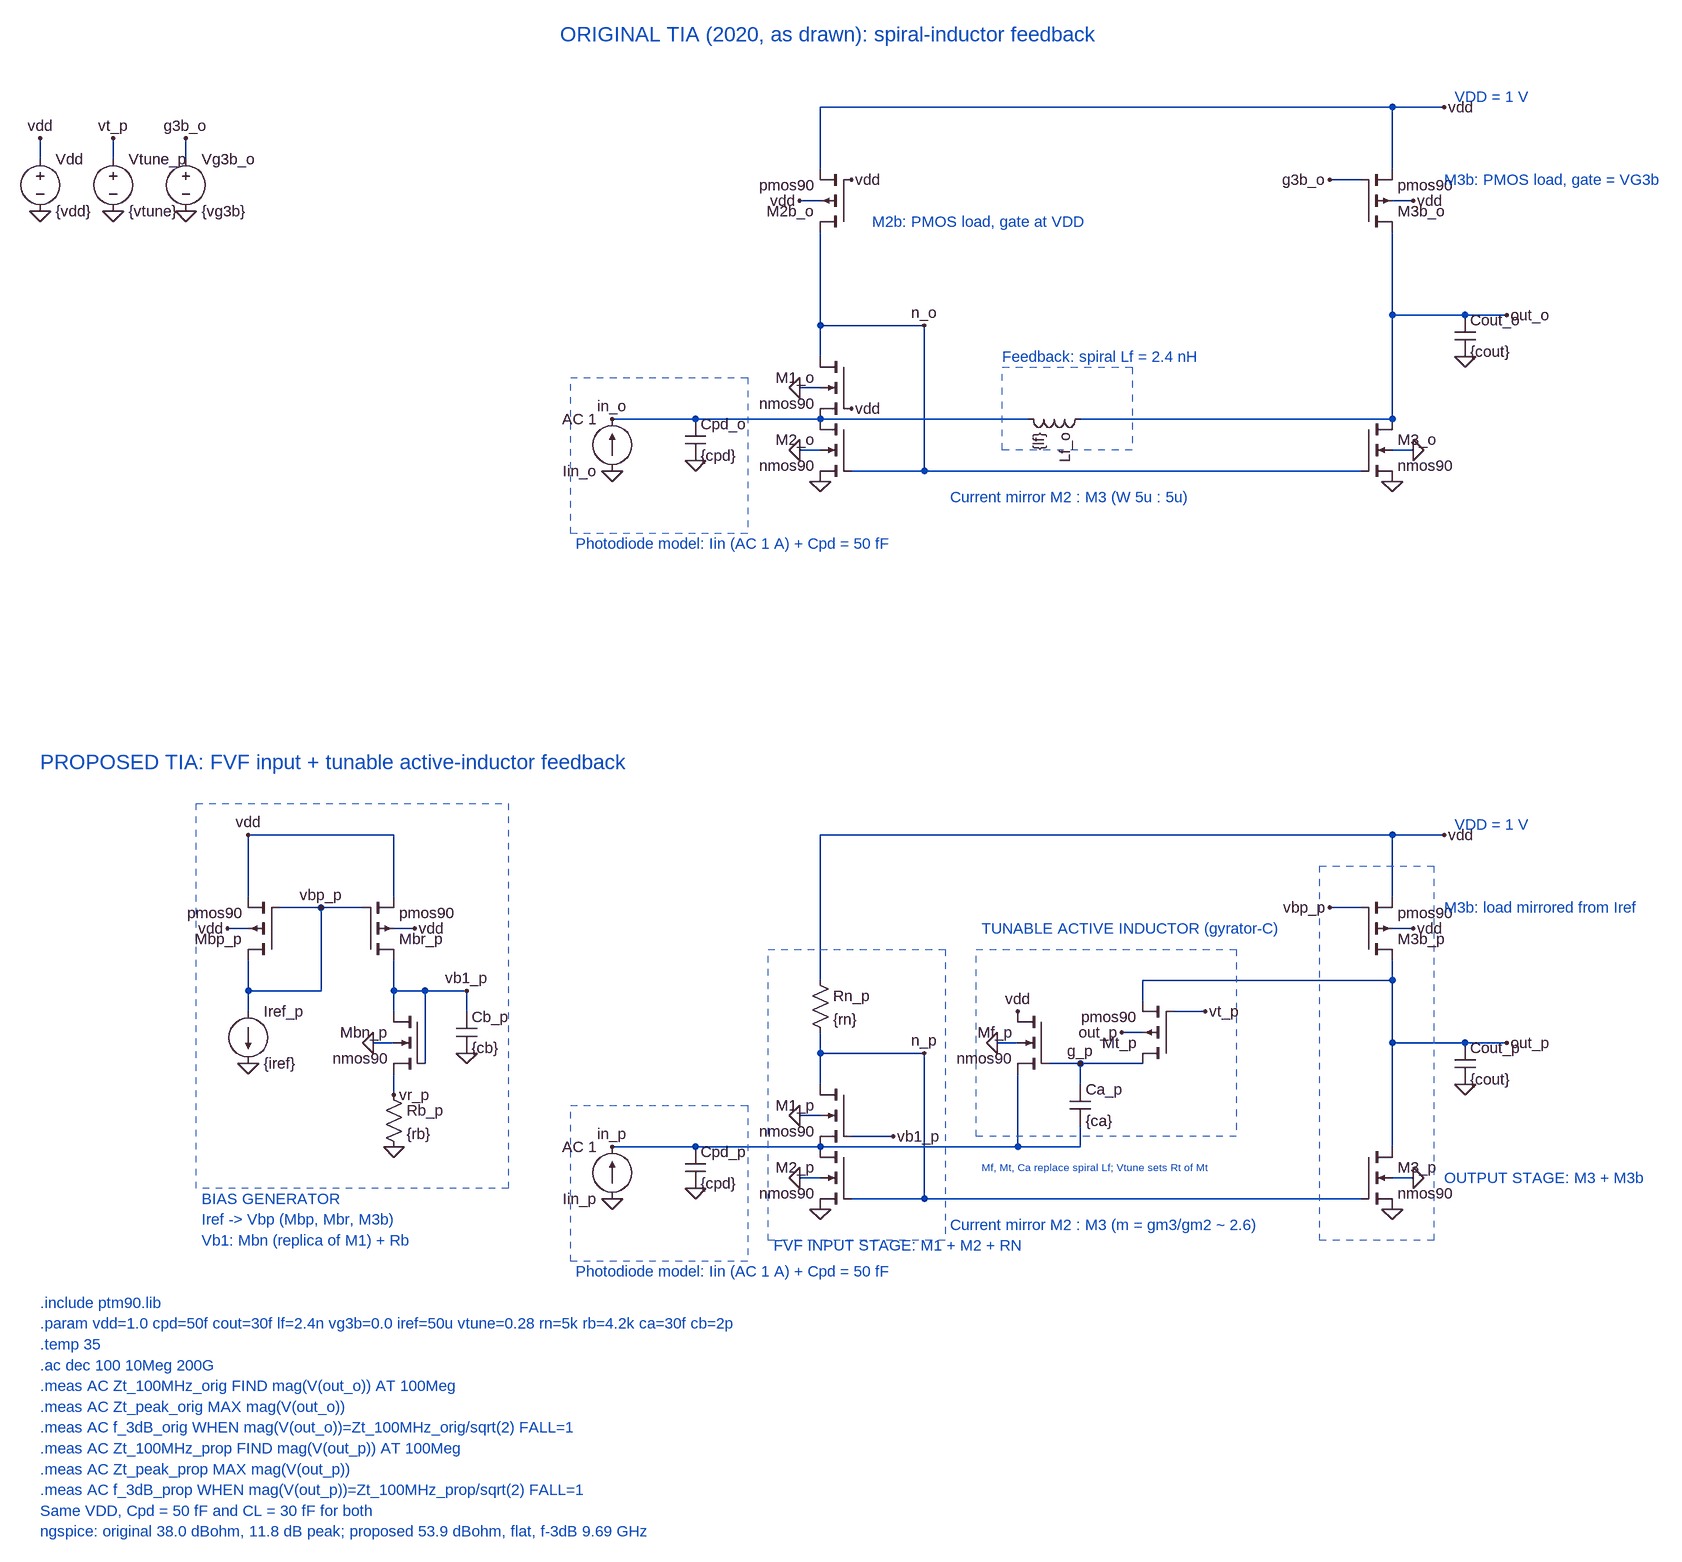
[diagram p0: schematic 5_original_vs_proposed.asc]
5_original_vs_proposed.asc, the LTspice schematic file:
Version 4
SHEET 1 3200 2800
WIRE 320 528 288 528
WIRE 1200 528 1232 528
WIRE 0 480 128 480
WIRE 128 480 320 480
WIRE 320 336 320 384
WIRE 320 336 480 336
WIRE 480 336 480 560
WIRE 368 560 480 560
WIRE 480 560 1152 560
WIRE 1200 192 1200 224
WIRE 1200 224 1200 320
WIRE 1200 320 1200 480
WIRE 1200 320 1312 320
WIRE 1312 320 1376 320
WIRE 320 0 1200 0
WIRE 1200 0 1280 0
WIRE 320 144 288 144
WIRE 320 96 320 0
WIRE 320 192 320 336
WIRE 320 432 288 432
WIRE 1200 144 1232 144
WIRE 1200 96 1200 0
WIRE 1152 112 1104 112
WIRE 320 480 640 480
WIRE 720 480 1200 480
WIRE 320 1648 288 1648
WIRE 1200 1648 1232 1648
WIRE 0 1600 128 1600
WIRE 128 1600 320 1600
WIRE 320 1456 320 1504
WIRE 320 1456 480 1456
WIRE 480 1456 480 1680
WIRE 368 1680 480 1680
WIRE 480 1680 1152 1680
WIRE 1200 1312 1200 1344
WIRE 1200 1344 1200 1440
WIRE 1200 1440 1200 1600
WIRE 1200 1440 1312 1440
WIRE 1312 1440 1376 1440
WIRE 320 1120 1200 1120
WIRE 1200 1120 1280 1120
WIRE 320 1344 320 1120
WIRE 320 1424 320 1456
WIRE 368 1584 432 1584
WIRE 320 1552 288 1552
WIRE 1200 1264 1232 1264
WIRE 1200 1216 1200 1120
WIRE 1152 1232 1104 1232
WIRE 624 1488 624 1600
WIRE 320 1600 624 1600
WIRE 624 1600 720 1600
WIRE 624 1440 592 1440
WIRE 720 1568 720 1600
WIRE 672 1472 720 1472
WIRE 720 1472 816 1472
WIRE 720 1472 720 1504
WIRE 816 1424 784 1424
WIRE 816 1376 816 1344
WIRE 816 1344 1200 1344
WIRE 864 1392 912 1392
WIRE -560 1264 -592 1264
WIRE -336 1264 -304 1264
WIRE -560 1216 -560 1120
WIRE -560 1120 -336 1120
WIRE -336 1120 -336 1216
WIRE -512 1232 -448 1232
WIRE -448 1232 -384 1232
WIRE -448 1232 -448 1360
WIRE -560 1312 -560 1360
WIRE -560 1360 -448 1360
WIRE -560 1360 -560 1392
WIRE -336 1312 -336 1360
WIRE -336 1360 -336 1392
WIRE -336 1360 -288 1360
WIRE -288 1360 -224 1360
WIRE -288 1360 -288 1472
WIRE -336 1440 -368 1440
WIRE -224 1360 -224 1392
WIRE -336 1488 -336 1520
WIRE -880 80 -880 48
WIRE -768 80 -768 48
WIRE -656 80 -656 48
FLAG 0 560 0
FLAG 0 480 in_o
FLAG 128 544 0
FLAG 288 528 0
FLAG 320 576 0
FLAG 1232 528 0
FLAG 1200 576 0
FLAG 480 336 n_o
FLAG 1312 384 0
FLAG 1376 320 out_o
FLAG 1280 0 vdd
FLAG 288 144 vdd
FLAG 368 112 vdd
FLAG 368 464 vdd
FLAG 288 432 0
FLAG 1232 144 vdd
FLAG 1104 112 g3b_o
FLAG 0 1680 0
FLAG 0 1600 in_p
FLAG 128 1664 0
FLAG 288 1648 0
FLAG 320 1696 0
FLAG 1232 1648 0
FLAG 1200 1696 0
FLAG 480 1456 n_p
FLAG 1312 1504 0
FLAG 1376 1440 out_p
FLAG 1280 1120 vdd
FLAG 432 1584 vb1_p
FLAG 288 1552 0
FLAG 1232 1264 vdd
FLAG 1104 1232 vbp_p
FLAG 624 1392 vdd
FLAG 592 1440 0
FLAG 720 1472 g_p
FLAG 784 1424 out_p
FLAG 912 1392 vt_p
FLAG -592 1264 vdd
FLAG -304 1264 vdd
FLAG -560 1120 vdd
FLAG -448 1232 vbp_p
FLAG -560 1472 0
FLAG -368 1440 0
FLAG -224 1456 0
FLAG -224 1360 vb1_p
FLAG -336 1520 vr_p
FLAG -336 1600 0
FLAG -880 48 vdd
FLAG -880 160 0
FLAG -768 48 vt_p
FLAG -768 160 0
FLAG -656 48 g3b_o
FLAG -656 160 0
SYMBOL current 0 560 R180
SYMATTR InstName Iin_o
SYMATTR Value AC 1
SYMBOL cap 112 480 R0
SYMATTR InstName Cpd_o
SYMATTR Value {cpd}
SYMBOL nmos4 368 480 M0
SYMATTR InstName M2_o
SYMATTR Value nmos90
SYMATTR Value2 l=90n w=5u ad=1p as=1p pd=10.4u ps=10.4u
SYMBOL nmos4 368 384 M0
SYMATTR InstName M1_o
SYMATTR Value nmos90
SYMATTR Value2 l=90n w=5u ad=1p as=1p pd=10.4u ps=10.4u
SYMBOL nmos4 1152 480 R0
SYMATTR InstName M3_o
SYMATTR Value nmos90
SYMATTR Value2 l=90n w=5u ad=1p as=1p pd=10.4u ps=10.4u
SYMBOL cap 1296 320 R0
SYMATTR InstName Cout_o
SYMATTR Value {cout}
SYMBOL pmos4 368 192 R180
SYMATTR InstName M2b_o
SYMATTR Value pmos90
SYMATTR Value2 l=90n w=0.9u ad=0.18p as=0.18p pd=2.2u ps=2.2u
SYMBOL pmos4 1152 192 M180
SYMATTR InstName M3b_o
SYMATTR Value pmos90
SYMATTR Value2 l=90n w=5u ad=1p as=1p pd=10.4u ps=10.4u
SYMBOL ind 736 464 R90
SYMATTR InstName Lf_o
SYMATTR Value {lf}
SYMBOL current 0 1680 R180
SYMATTR InstName Iin_p
SYMATTR Value AC 1
SYMBOL cap 112 1600 R0
SYMATTR InstName Cpd_p
SYMATTR Value {cpd}
SYMBOL nmos4 368 1600 M0
SYMATTR InstName M2_p
SYMATTR Value nmos90
SYMATTR Value2 l=90n w=3.5u ad=0.7p as=0.7p pd=7.4u ps=7.4u
SYMBOL nmos4 368 1504 M0
SYMATTR InstName M1_p
SYMATTR Value nmos90
SYMATTR Value2 l=90n w=4.5u ad=0.9p as=0.9p pd=9.4u ps=9.4u
SYMBOL nmos4 1152 1600 R0
SYMATTR InstName M3_p
SYMATTR Value nmos90
SYMATTR Value2 l=90n w=7u ad=1.4p as=1.4p pd=14.4u ps=14.4u
SYMBOL cap 1296 1440 R0
SYMATTR InstName Cout_p
SYMATTR Value {cout}
SYMBOL res 304 1328 R0
SYMATTR InstName Rn_p
SYMATTR Value {rn}
SYMBOL pmos4 1152 1312 M180
SYMATTR InstName M3b_p
SYMATTR Value pmos90
SYMATTR Value2 l=180n w=28u ad=5.6p as=5.6p pd=56.4u ps=56.4u
SYMBOL nmos4 672 1392 M0
SYMATTR InstName Mf_p
SYMATTR Value nmos90
SYMATTR Value2 l=90n w=3.5u ad=0.7p as=0.7p pd=7.4u ps=7.4u
SYMBOL cap 704 1504 R0
SYMATTR InstName Ca_p
SYMATTR Value {ca}
SYMBOL pmos4 864 1472 R180
SYMATTR InstName Mt_p
SYMATTR Value pmos90
SYMATTR Value2 l=90n w=12u ad=2.4p as=2.4p pd=24.4u ps=24.4u
SYMBOL pmos4 -512 1312 R180
SYMATTR InstName Mbp_p
SYMATTR Value pmos90
SYMATTR Value2 l=180n w=2u ad=0.4p as=0.4p pd=4.4u ps=4.4u
SYMBOL pmos4 -384 1312 M180
SYMATTR InstName Mbr_p
SYMATTR Value pmos90
SYMATTR Value2 l=180n w=2u ad=0.4p as=0.4p pd=4.4u ps=4.4u
SYMBOL current -560 1392 R0
SYMATTR InstName Iref_p
SYMATTR Value {iref}
SYMBOL nmos4 -288 1392 M0
SYMATTR InstName Mbn_p
SYMATTR Value nmos90
SYMATTR Value2 l=90n w=0.4u ad=0.08p as=0.08p pd=1.2u ps=1.2u
SYMBOL cap -240 1392 R0
SYMATTR InstName Cb_p
SYMATTR Value {cb}
SYMBOL res -352 1504 R0
SYMATTR InstName Rb_p
SYMATTR Value {rb}
SYMBOL voltage -880 64 R0
SYMATTR InstName Vdd
SYMATTR Value {vdd}
SYMBOL voltage -768 64 R0
SYMATTR InstName Vtune_p
SYMATTR Value {vtune}
SYMBOL voltage -656 64 R0
SYMATTR InstName Vg3b_o
SYMATTR Value {vg3b}
RECTANGLE Normal -64 416 208 656 1
RECTANGLE Normal 600 400 800 528 2
RECTANGLE Normal -64 1536 208 1776 1
RECTANGLE Normal 560 1296 960 1584 1
RECTANGLE Normal 240 1296 512 1744 1
RECTANGLE Normal 1088 1168 1264 1744 1
RECTANGLE Normal -640 1072 -160 1664 1
TEXT 1296 -16 Left 2 ;VDD = 1 V
TEXT -56 672 Left 2 ;Photodiode model: Iin (AC 1 A) + Cpd = 50 fF
TEXT 600 384 Left 2 ;Feedback: spiral Lf = 2.4 nH
TEXT 400 176 Left 2 ;M2b: PMOS load, gate at VDD
TEXT 1280 112 Left 2 ;M3b: PMOS load, gate = VG3b
TEXT 520 600 Left 2 ;Current mirror M2 : M3 (W 5u : 5u)
TEXT 1296 1104 Left 2 ;VDD = 1 V
TEXT -56 1792 Left 2 ;Photodiode model: Iin (AC 1 A) + Cpd = 50 fF
TEXT 568 1264 Left 2 ;TUNABLE ACTIVE INDUCTOR (gyrator-C)
TEXT 568 1632 Left 1 ;Mf, Mt, Ca replace spiral Lf; Vtune sets Rt of Mt
TEXT 248 1752 Left 2 ;FVF INPUT STAGE: M1 + M2 + RN
TEXT 520 1720 Left 2 ;Current mirror M2 : M3 (m = gm3/gm2 ~ 2.6)
TEXT 1280 1232 Left 2 ;M3b: load mirrored from Iref
TEXT 1280 1648 Left 2 ;OUTPUT STAGE: M3 + M3b
TEXT -632 1680 Left 2 ;BIAS GENERATOR
TEXT -632 1712 Left 2 ;Iref -> Vbp (Mbp, Mbr, M3b)
TEXT -632 1744 Left 2 ;Vb1: Mbn (replica of M1) + Rb
TEXT -80 -112 Left 3 ;ORIGINAL TIA (2020, as drawn): spiral-inductor feedback
TEXT -880 1008 Left 3 ;PROPOSED TIA: FVF input + tunable active-inductor feedback
TEXT -880 1840 Left 2 .include ptm90.lib
TEXT -880 1872 Left 2 .param vdd=1.0 cpd=50f cout=30f lf=2.4n vg3b=0.0 iref=50u vtune=0.28 rn=5k rb=4.2k ca=30f cb=2p
TEXT -880 1904 Left 2 .temp 35
TEXT -880 1936 Left 2 .ac dec 100 10Meg 200G
TEXT -880 1968 Left 2 .meas AC Zt_100MHz_orig FIND mag(V(out_o)) AT 100Meg
TEXT -880 2000 Left 2 .meas AC Zt_peak_orig MAX mag(V(out_o))
TEXT -880 2032 Left 2 .meas AC f_3dB_orig WHEN mag(V(out_o))=Zt_100MHz_orig/sqrt(2) FALL=1
TEXT -880 2064 Left 2 .meas AC Zt_100MHz_prop FIND mag(V(out_p)) AT 100Meg
TEXT -880 2096 Left 2 .meas AC Zt_peak_prop MAX mag(V(out_p))
TEXT -880 2128 Left 2 .meas AC f_3dB_prop WHEN mag(V(out_p))=Zt_100MHz_prop/sqrt(2) FALL=1
TEXT -880 2160 Left 2 ;Same VDD, Cpd = 50 fF and CL = 30 fF for both
TEXT -880 2192 Left 2 ;ngspice: original 38.0 dBohm, 11.8 dB peak; proposed 53.9 dBohm, flat, f-3dB 9.69 GHz

The netlist it stands for:
* 5_original_vs_proposed.asc
Iin_o 0 in_o AC 1
Cpd_o in_o 0 {cpd}
M2_o in_o n_o 0 0 nmos90 l=90n w=5u ad=1p as=1p pd=10.4u ps=10.4u
M1_o n_o vdd in_o 0 nmos90 l=90n w=5u ad=1p as=1p pd=10.4u ps=10.4u
M3_o out_o n_o 0 0 nmos90 l=90n w=5u ad=1p as=1p pd=10.4u ps=10.4u
Cout_o out_o 0 {cout}
M2b_o n_o vdd vdd vdd pmos90 l=90n w=0.9u ad=0.18p as=0.18p pd=2.2u ps=2.2u
M3b_o out_o g3b_o vdd vdd pmos90 l=90n w=5u ad=1p as=1p pd=10.4u ps=10.4u
Lf_o out_o in_o {lf}
Iin_p 0 in_p AC 1
Cpd_p in_p 0 {cpd}
M2_p in_p n_p 0 0 nmos90 l=90n w=3.5u ad=0.7p as=0.7p pd=7.4u ps=7.4u
M1_p n_p vb1_p in_p 0 nmos90 l=90n w=4.5u ad=0.9p as=0.9p pd=9.4u ps=9.4u
M3_p out_p n_p 0 0 nmos90 l=90n w=7u ad=1.4p as=1.4p pd=14.4u ps=14.4u
Cout_p out_p 0 {cout}
Rn_p vdd n_p {rn}
M3b_p out_p vbp_p vdd vdd pmos90 l=180n w=28u ad=5.6p as=5.6p pd=56.4u ps=56.4u
Mf_p vdd g_p in_p 0 nmos90 l=90n w=3.5u ad=0.7p as=0.7p pd=7.4u ps=7.4u
Ca_p g_p in_p {ca}
Mt_p g_p vt_p out_p out_p pmos90 l=90n w=12u ad=2.4p as=2.4p pd=24.4u ps=24.4u
Mbp_p vbp_p vbp_p vdd vdd pmos90 l=180n w=2u ad=0.4p as=0.4p pd=4.4u ps=4.4u
Mbr_p vb1_p vbp_p vdd vdd pmos90 l=180n w=2u ad=0.4p as=0.4p pd=4.4u ps=4.4u
Iref_p vbp_p 0 {iref}
Mbn_p vb1_p vb1_p vr_p 0 nmos90 l=90n w=0.4u ad=0.08p as=0.08p pd=1.2u ps=1.2u
Cb_p vb1_p 0 {cb}
Rb_p vr_p 0 {rb}
Vdd vdd 0 {vdd}
Vtune_p vt_p 0 {vtune}
Vg3b_o g3b_o 0 {vg3b}
.model NMOS NMOS
.model PMOS PMOS
.lib standard.mos
* VDD = 1 V
* Photodiode model: Iin (AC 1 A) + Cpd = 50 fF
* Feedback: spiral Lf = 2.4 nH
* M2b: PMOS load, gate at VDD
* M3b: PMOS load, gate = VG3b
* Current mirror M2 : M3 (W 5u : 5u)
* VDD = 1 V
* Photodiode model: Iin (AC 1 A) + Cpd = 50 fF
* TUNABLE ACTIVE INDUCTOR (gyrator-C)
* Mf, Mt, Ca replace spiral Lf; Vtune sets Rt of Mt
* FVF INPUT STAGE: M1 + M2 + RN
* Current mirror M2 : M3 (m = gm3/gm2 ~ 2.6)
* M3b: load mirrored from Iref
* OUTPUT STAGE: M3 + M3b
* BIAS GENERATOR
* Iref -> Vbp (Mbp, Mbr, M3b)
* Vb1: Mbn (replica of M1) + Rb
* ORIGINAL TIA (2020, as drawn): spiral-inductor feedback
* PROPOSED TIA: FVF input + tunable active-inductor feedback
* .include ptm90.lib
* .param vdd=1.0 cpd=50f cout=30f lf=2.4n vg3b=0.0 iref=50u vtune=0.28 rn=5k rb=4.2k ca=30f cb=2p
* .temp 35
* .ac dec 100 10Meg 200G
* .meas AC Zt_100MHz_orig FIND mag(V(out_o)) AT 100Meg
* .meas AC Zt_peak_orig MAX mag(V(out_o))
* .meas AC f_3dB_orig WHEN mag(V(out_o))=Zt_100MHz_orig/sqrt(2) FALL=1
* .meas AC Zt_100MHz_prop FIND mag(V(out_p)) AT 100Meg
* .meas AC Zt_peak_prop MAX mag(V(out_p))
* .meas AC f_3dB_prop WHEN mag(V(out_p))=Zt_100MHz_prop/sqrt(2) FALL=1
* Same VDD, Cpd = 50 fF and CL = 30 fF for both
* ngspice: original 38.0 dBohm, 11.8 dB peak; proposed 53.9 dBohm, flat, f-3dB 9.69 GHz
.backanno
.end